# Altium project GTV4.0_Board.PrjPcb (part 11 of 11)
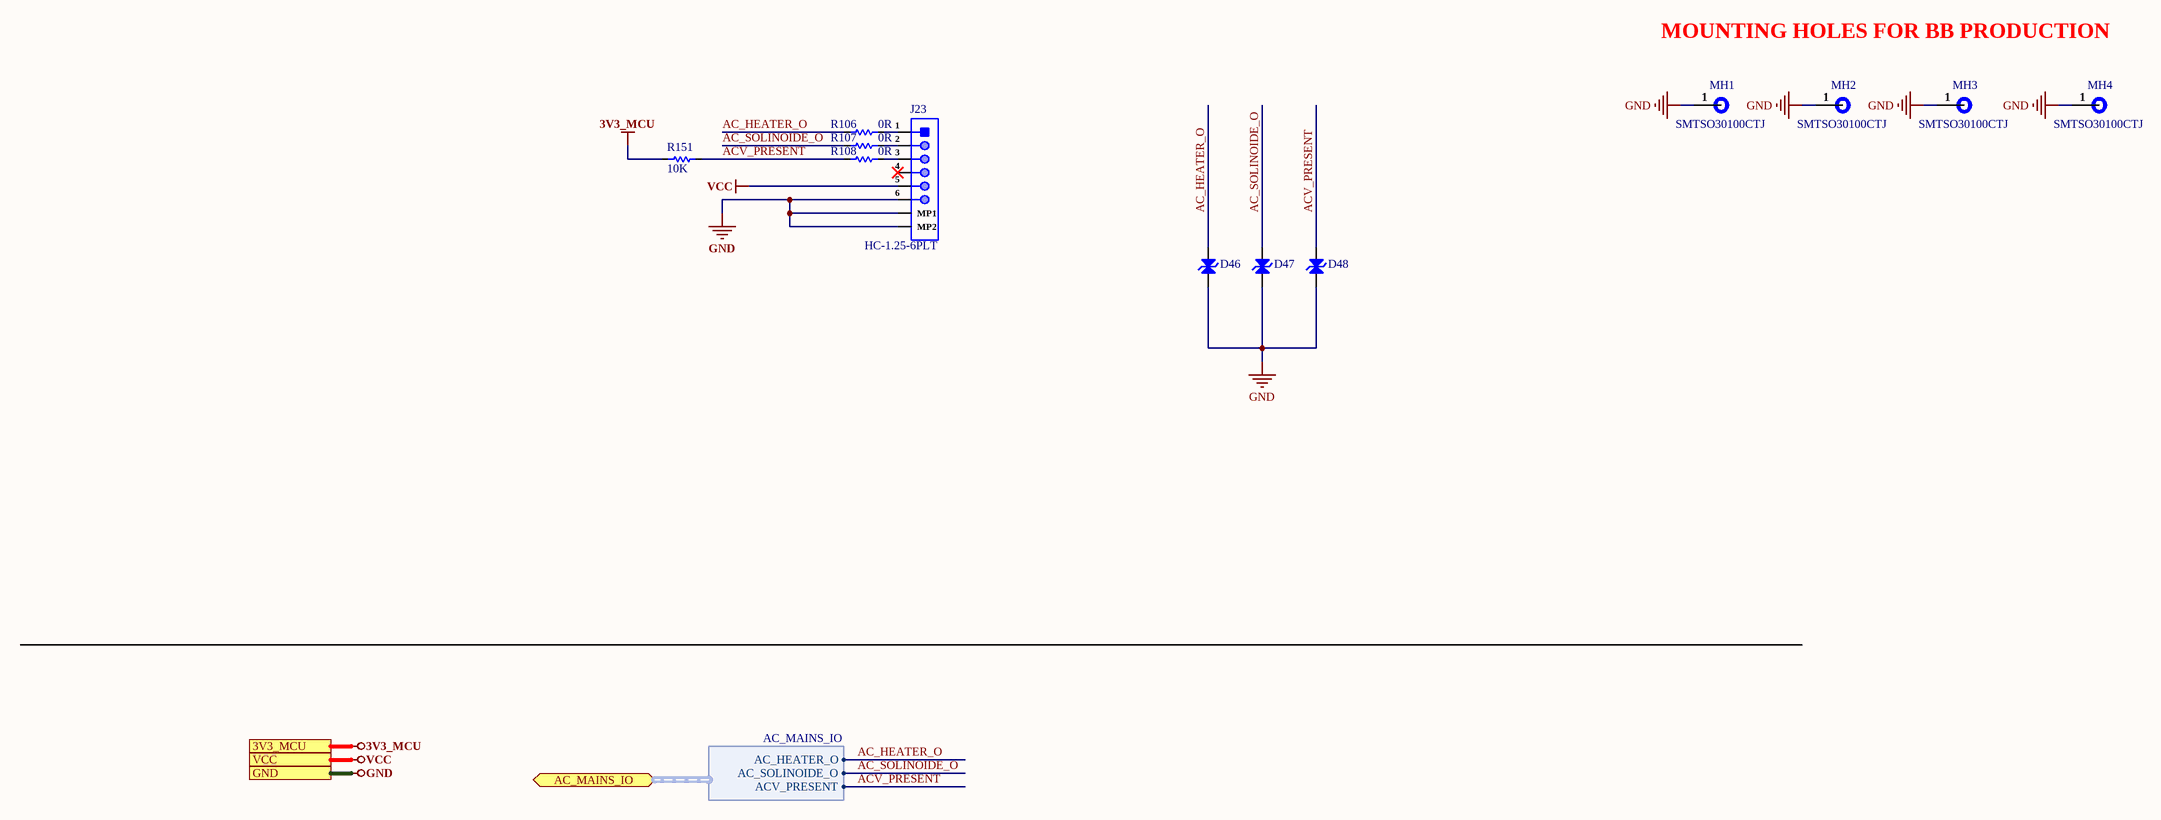
[diagram p21: ACMains_Connection_Sheet.SchDoc]

## Nets that join several sheets
3V3: Regulator_Section (5 pins), Onboard_Sensor_Section (8 pins), SD-Card-Sheet (8 pins), Valve_Section (C135.2 U31.5), Temperature_Sense_Section (32 pins), Level_Solinoide_Section (R79.1)
3V3_MCU: Regulator_Section (8 pins), Controller_Section (33 pins), Valve_Section (R176.2 R177.2), LED_Section (Q26.1 R73.1), ACMains_Connection_Sheet (R151.2)
5V: Current_Sense_Section (6 pins), Regulator_Section (11 pins), Onboard_Sensor_Section (J7.1 R35.1 SB8.2), Receiver_Section (C71.2 R26.2 U29.5), WIFI_Display_Sheet (R127.2 R135.1 U22.3), Gate_Driver_Section (6 pins)
5V-LED: Regulator_Section (5 pins), LED_Section (J18.1 R74.1)
BAT: Reverse Protection_Section (C2.2 J2.2 R149.2), Solar_Charge_Controller (7 pins)
GND: Current_Sense_Section (12 pins), Voltage_Monitoring_Section (5 pins), Regulator_Section (41 pins), Reverse Protection_Section (5 pins), Solar_Charge_Controller (11 pins), Onboard_Sensor_Section (22 pins), Receiver_Section (15 pins), Controller_Section (38 pins), SD-Card-Sheet (13 pins), WIFI_Display_Sheet (8 pins), Valve_Section (36 pins), Temperature_Sense_Section (47 pins), Level_Solinoide_Section (U9.2 U9.3), Gate_Driver_Section (9 pins), LED_Section (J18.3 Q4.2 R44.1), NFC_Sheet (12 pins), Heater_Section (14 pins), GSM_Sheet (11 pins), ACMains_Connection_Sheet (10 pins)
GSM_PWR: Regulator_Section (20 pins), WIFI_Display_Sheet (R134.1 R137.2 U22.6), GSM_Sheet (J19.11 J19.12)
VCC: Current_Sense_Section (U1.3 U1.4 U2.3 U2.4), Reverse Protection_Section (SB12.1), Onboard_Sensor_Section (SB10.2), Controller_Section (R12.2), WIFI_Display_Sheet (J13.12), Valve_Section (21 pins), Temperature_Sense_Section (J22.14 J34.1 J38.1 R119.1), Level_Solinoide_Section (J11.1), LED_Section (J10.1), NFC_Sheet (J17.9 J17.10), Heater_Section (C24.1 C25.2 Q7.2), ACMains_Connection_Sheet (J23.5)
VCC#12: Voltage_Monitoring_Section (Q32.3 R34.2 SB11.1), Regulator_Section (D11.2)
VCC#P: Voltage_Monitoring_Section (SB9.2), Reverse Protection_Section (9 pins)
AC_HEATER_O: Controller_Section (U21.114), ACMains_Connection_Sheet (D46.2 R106.1)
AC_SOLINOIDE_O: Controller_Section (U21.115), ACMains_Connection_Sheet (D47.2 R107.1)
ACV_PRESENT: Controller_Section (U21.136), ACMains_Connection_Sheet (D48.2 R108.1 R151.1)
ADDR-LED: Controller_Section (U21.65), LED_Section (Q26.2 R73.2)
BACKUP: Regulator_Section (C123.2 R162.1 R163.2), Controller_Section (U21.124)
BOOT0: Controller_Section (R16.1 U21.138), WIFI_Display_Sheet (J13.3)
BUZZER: Onboard_Sensor_Section (R6.1), Controller_Section (U21.82)
CE: Solar_Charge_Controller (Q39.1), Controller_Section (U21.13)
CLK: Controller_Section (U21.74), SD-Card-Sheet (D22.2 J30.5 R158.1)
CMD: Controller_Section (U21.76), SD-Card-Sheet (D21.2 J30.3 R157.1)
CRNT_SNS.IP+_1: Current_Sense_Section (U1.1 U1.2), Gate_Driver_Section (D9.2 J3.2)
CRNT_SNS.IP+_2: Current_Sense_Section (U2.1 U2.2), Gate_Driver_Section (D10.2 J4.2)
CRNT_VOUT.VIOUT1: Current_Sense_Section (C11.1 R5.2 R7.1), Controller_Section (U21.28)
CRNT_VOUT.VIOUT2: Current_Sense_Section (C19.1 R8.2 R10.1), Controller_Section (U21.29)
DAC_SCL: Controller_Section (U21.11), Valve_Section (R177.1 U37.1)
DAC_SDA: Controller_Section (U21.10), Valve_Section (R176.1 U37.2)
DAT0: Controller_Section (U21.75), SD-Card-Sheet (D23.2 J30.7 R159.1)
DAT3: Controller_Section (U21.73), SD-Card-Sheet (D20.2 J30.2 R156.1)
DR_485_1: Controller_Section (U21.26), Temperature_Sense_Section (R139.1 R200.1 U33.2 U33.3)
DR_485_2: Controller_Section (U21.27), Temperature_Sense_Section (R142.1 R212.1 U35.2 U35.3)
DR_485_3: Controller_Section (U21.44), Temperature_Sense_Section (D51.2 R76.1 R145.1 R201.1)
DR_485_4: Controller_Section (U21.45), Temperature_Sense_Section (D54.2 R81.1 R148.1 R213.1)
ENA: Controller_Section (U21.7), Gate_Driver_Section (U11.2)
ESP_RXD2: Receiver_Section (R28.1), WIFI_Display_Sheet (J13.6)
ESP_TXD2: Receiver_Section (R33.1), WIFI_Display_Sheet (J13.5)
FILL_CNTRL: Controller_Section (U21.5), Valve_Section (R118.1)
FLOW_MCU1: Controller_Section (U21.79), Temperature_Sense_Section (D59.2 R86.1)
FLOW_MCU2: Controller_Section (U21.78), Temperature_Sense_Section (D60.2 R87.1)
FLOW_MCU3: Controller_Section (U21.77), Temperature_Sense_Section (D61.2 R88.1)
FLUSH_CNTRL: Controller_Section (U21.4), Temperature_Sense_Section (D55.2 R82.1)
GNSS_MCU_RX: Controller_Section (U21.97), GSM_Sheet (D17.2 R97.1)
GNSS_MCU_TX: Controller_Section (U21.96), GSM_Sheet (D18.2 R98.1)
GNSS_PWRCTRL: Controller_Section (U21.12), GSM_Sheet (D32.2 R103.1)
GSM_PWR_EN: Controller_Section (U21.141), GSM_Sheet (D26.2 R101.1)
GSM_RST: Controller_Section (U21.142), GSM_Sheet (D27.2 R102.1)
HC_PWR: Receiver_Section (R26.1 R170.2 U29.4), Controller_Section (U21.117)
HC_SET_O: Receiver_Section (R41.1), WIFI_Display_Sheet (J13.7)
HEAT_1_CNTRL: Controller_Section (U21.92), Heater_Section (R18.1)
HEAT_CNTRL: Controller_Section (U21.93), Heater_Section (D45.2 R115.1)
INA_1: Controller_Section (U21.59), Gate_Driver_Section (U8.2)
INB_1: Controller_Section (U21.60), Gate_Driver_Section (U10.2)
IO_C9: Controller_Section (U21.15), Heater_Section (D44.2 R114.1)
IRQ_NFC: Controller_Section (U21.139), NFC_Sheet (D66.2 J17.5)
LEVEL_MCU: Controller_Section (U21.85), Level_Solinoide_Section (R79.2 U9.4)
MCU_RX: Controller_Section (U21.102), GSM_Sheet (D19.2 R99.1)
MCU_TX: Controller_Section (U21.101), GSM_Sheet (D25.2 R100.1)
MEM_CNTRL: Controller_Section (U21.3), Temperature_Sense_Section (D56.2 R83.1)
MicroSD_DET: Controller_Section (U21.140), SD-Card-Sheet (D24.2 J30.SW-A R160.1)
MISO_NFC: Controller_Section (U21.134), NFC_Sheet (R93.1)
MOSI_NFC: Controller_Section (U21.135), NFC_Sheet (R117.1)
NRST: Onboard_Sensor_Section (J1.10), Controller_Section (C73.2 SW3.3 U21.25), WIFI_Display_Sheet (J13.4)
PIR_OUT: Onboard_Sensor_Section (R9.1), Controller_Section (U21.99)
PM_CNTRL: Controller_Section (U21.2), Valve_Section (R123.1)
PS_MCU: Controller_Section (U21.80), Temperature_Sense_Section (D58.2 D70.2 SB4.1 SB5.1)
PWM_D2: Onboard_Sensor_Section (Q3.3 R20.2), Controller_Section (U21.81)
RE/DE/RS485/T: Controller_Section (U21.88), NFC_Sheet (D68.2 R95.1)
READY: Regulator_Section (R161.1 U5.3), Controller_Section (U21.125)
RS_CNTRL: Controller_Section (U21.1), Temperature_Sense_Section (D57.2 R84.1)
RX: Receiver_Section (R27.1), Controller_Section (U21.116)
RX_AUX: Controller_Section (U21.126), NFC_Sheet (R92.1)
RXD/RS485/RS232/T: Controller_Section (U21.87), NFC_Sheet (D67.2 R94.1)
RXIN1: Controller_Section (U21.70), Heater_Section (D33.2 R110.1)
RXIN2: Controller_Section (U21.112), Heater_Section (D38.2 R112.1)
SCK_NFC: Controller_Section (U21.133), NFC_Sheet (D62.2 R89.1)
SET: Receiver_Section (R40.1), Controller_Section (U21.118)
SHDN: Reverse Protection_Section (R32.1 SB7.1), Controller_Section (U21.14)
SNS_IN: Onboard_Sensor_Section (SB1.1), Controller_Section (U21.100)
SR_BR_CS: Controller_Section (R219.1), Temperature_Sense_Section (R187.1 U32.2)
SR_BR_MISO: Controller_Section (R217.1), Temperature_Sense_Section (R178.1 U32.5)
SR_BR_MOSI: Controller_Section (R218.1), Temperature_Sense_Section (R179.1 U32.4)
SR_BR_SCK: Controller_Section (R216.1), Temperature_Sense_Section (R180.1 U32.3)
SS_NFC: Controller_Section (U21.110), NFC_Sheet (D65.2 J17.4)
SWCLK: Onboard_Sensor_Section (J1.4), Controller_Section (U21.109)
SWDIO: Onboard_Sensor_Section (J1.2), Controller_Section (U21.105)
TEMP_SNS: Controller_Section (R31.2 U21.64), Temperature_Sense_Section (J9.2)
TX: Receiver_Section (R29.1), Controller_Section (U21.113)
TX_AUX: Controller_Section (U21.127), NFC_Sheet (R116.1)
TXD/RS485/RS232/T: Controller_Section (U21.89), NFC_Sheet (D69.2 R96.1)
TXIN1: Controller_Section (U21.69), Heater_Section (D36.2 R111.1)
TXIN2: Controller_Section (U21.111), Heater_Section (D43.2 R113.1)
USB_D_N: Onboard_Sensor_Section (D4.2 J7.2), Controller_Section (U21.103)
USB_D_P: Onboard_Sensor_Section (D4.1 J7.3), Controller_Section (U21.104)
W_LED_CNTRL: Controller_Section (U21.68), LED_Section (R44.2 R124.1)
WIFI_RX1: Controller_Section (U21.36), WIFI_Display_Sheet (J13.2)
WIFI_TX1: Controller_Section (U21.37), WIFI_Display_Sheet (J13.1)